# Altium project STM32_LowNoise_Amplifier.PrjPcb
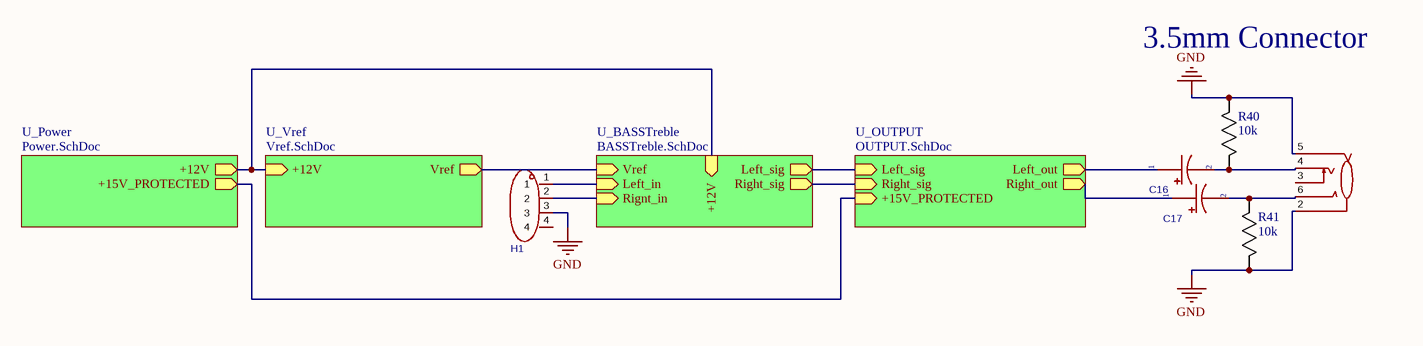
[diagram p0: TOP.SchDoc]
5 sheets, 88 parts. Net scope: hierarchical (ports join the sheet entries above them; power ports are global).
Board file: PCB1.PcbDoc
Sheets:
  TOP.SchDoc
    U_BASSTreble = BASSTreble.SchDoc
    U_Vref = Vref.SchDoc
    U_Power = Power.SchDoc
    U_OUTPUT = OUTPUT.SchDoc

## Sheet TOP.SchDoc
size A4; SheetNumber: 1; SheetTotal: 5

### Parts
C16  2200uF  [ELC CAP D=5]  (value not drawn)
C17  2200uF  [ELC CAP D=5]  (value not drawn)
CN1  pj-327a_c49284723  [3.5mm 5pin SMD]  (value not drawn)
H1  pz254r-11-04p  [4pin connector]  (value not drawn)
R40  10k  [0603 RES]
R41  10k  [0603 RES]

### Sub-sheets
U_BASSTreble = BASSTreble.SchDoc: Vref (in), Left_in (in), Rignt_in (in), Left_sig (out), Right_sig (out), +12V (in)
U_OUTPUT = OUTPUT.SchDoc: Left_sig (in), Right_sig (in), +15V_PROTECTED (in), Left_out (out), Right_out (out)
U_Power = Power.SchDoc: +12V (out), +15V_PROTECTED (out)
U_Vref = Vref.SchDoc: Vref (out), +12V (in)

### Nets
+12V: sheet U_BASSTreble/+12V, sheet U_Vref/+12V, sheet U_Power/+12V
+15V_PROTECTED: sheet U_Power/+15V_PROTECTED, sheet U_OUTPUT/+15V_PROTECTED
GND: CN1.2 CN1.5 H1.3 R40.1 R41.2
Vref: sheet U_BASSTreble/Vref, sheet U_Vref/Vref
NetC12_1: H1.1 ; sheet U_BASSTreble/Left_in
NetC16_1: C16.1 ; sheet U_OUTPUT/Left_out
NetC16_2: C16.2 CN1.4 R40.2
NetC17_1: C17.1 ; sheet U_OUTPUT/Right_out
NetC17_2: C17.2 CN1.6 R41.1
NetC24_1: H1.2 ; sheet U_BASSTreble/Rignt_in
NetR19_1: sheet U_BASSTreble/Left_sig, sheet U_OUTPUT/Left_sig
NetR33_1: sheet U_BASSTreble/Right_sig, sheet U_OUTPUT/Right_sig

Not connected (* = marked no-connect by the designer): CN1 3; H1 4

### Notes on the sheet
- (near R40) 3.5mm Connector

### Library data of the parts
C16 C17 = CAP_ELECTROLYTIC: Tolerance:±20% Voltage Rating:25V Pin Spacing:5mm Diameter:12.5mm Height - Seated (Max):25mm Lifetime:2000hrs@105℃ Operating Temperature:-40℃~+105℃ Operating Temperature:-40℃~+105℃ Polarity type:Polarized; Manufacturer: Jianghai(南通江海); Symbol: ECR1EBK222MLL125025; AddInBom: yes; ModelId: bba5f7414a9d4a73a222d32de1544099; ModelName: CAP-TH_D12.5-H20.0-P5.00; ModelTransform: 492.5187,492.11201,0,0,0,0,0,0,-137.795; Tolerance: ±20%; Voltage Rating: 25V; Pin Spacing: 5mm; LCSC Part Name: 2200uF ±20% 25V; SupplierPart: C233102; ManufacturerPart: ECR1EBK222MLL125025; Supplier Footprint: 插件; JLCPCB Part Class: Extended Part; Datasheet: https://item.szlcsc.com/datasheet/ECR1EBK222MLL125025/232937.html; Supplier: LCSC; ConvertToPcb: yes; FootprintName: CAP-TH_BD12.5-P5.00-D0.6-FD; Value: 2200uF; Diameter: 12.5mm; Height - Seated (Max): 25mm; Lifetime: 2000hrs@105℃; Operating Temperature: -40℃~+105℃; Polarity type: Polarized
CN1 = 3.5mm 5pin SMD: Connector Type:3.5mm Headphone Jack Current Rating:500mA Voltage Rating (Max):30V Contact Material:Copper Contact Plating:Silver Operating Temperature:-25℃~+85℃ Operating Temperature:-25℃~+85℃ Rank Number:TRRS Mounting Style:Surface Mount Color:Black Body; Manufacturer: XUNPU(讯普); AddInBom: yes; ModelId: 28a3bb7a9e024b9f97707116e53a84e6; ModelName: AUDIO-SMD_XUNPU_PJ-327A; ModelTransform: 559.054,338.55094,0,0,0,0,-55.118,0,-25.591; Current Rating: 500mA; Voltage Rating (Max): 30V; Rank Number: TRRS; Body Height: 4.4mm; Symbol: PJ-327A; LCSC Part Name: 3.5mm耳机座; SupplierPart: C49284723; ManufacturerPart: PJ-327A; Supplier Footprint: SMD; JLCPCB Part Class: Extended Part; Datasheet: https://item.szlcsc.com/datasheet/PJ-327A/51736272.html; Supplier: LCSC; ConvertToPcb: yes; FootprintName: AUDIO-SMD_XUNPU_PJ-327A; Connector Type: 3.5mm Headphone Jack; Contact Material: Copper; Contact Plating: Silver; Operating Temperature: -25℃~+85℃; Mounting Style: Surface Mount; Color: Black; Length: 14.2mm; Width: 6mm
H1 = 4pin connector: Pin Structure:1x4P Pitch:2.54mm Row Spacing:- Circluar Pins/Square Pins:Pin Header Mounting Type:Right Angle Number of Rows:1 Number of Pins:4P Current Rating:3A Voltage Rating (Max):250V Length of Mating Pin:6mm Insulation Height:2.5mm Length of End Conn; Manufacturer: XFCN(兴飞); AddInBom: yes; ModelId: 13284729e4054d7b9656609df5ff9409; ModelName: HDR-TH_4P-P2.54-M-WI-1X4P; ModelTransform: 399.999,417.322,0,180,0,0,0,-196.85,-118.11; Pin Structure: 1x4P; Pitch: 2.54mm; Current Rating: 3A; Voltage Rating (Max): 250V; Symbol: PZ254R-11-04P; LCSC Part Name: 1x4P 间距:2.54mm 方针 弯插; SupplierPart: C492412; ManufacturerPart: PZ254R-11-04P; Supplier Footprint: 弯插,P=2.54mm; JLCPCB Part Class: Extended Part; Datasheet: https://item.szlcsc.com/datasheet/PZ254R-11-04P/502968.html; Supplier: LCSC; ConvertToPcb: yes; FootprintName: HDR-TH_4P-P2.54-H-M-W10.4; Row Spacing: -; Circluar Pins/Square Pins: Pin Header; Mounting Type: Right Angle; Number of Rows: 1; Number of Pins: 4P; Length of Mating Pin: 6mm; Insulation Height: 2.5mm; Length of End Connection Pin: -; Contact Material: Brass; Contact Plating: -; Operating Temperature: -40℃~+105℃; Color: Black
R40 R41 = Resistor: Manufacturer_Name: Vishay; Manufacturer_Part_Number: CRCW060310K0FKEA; Copyright: Copyright (C) 2025 Ultra Librarian. All rights reserved.

## Sheet BASSTreble.SchDoc
size A4; SheetNumber: 3; SheetTotal: 5
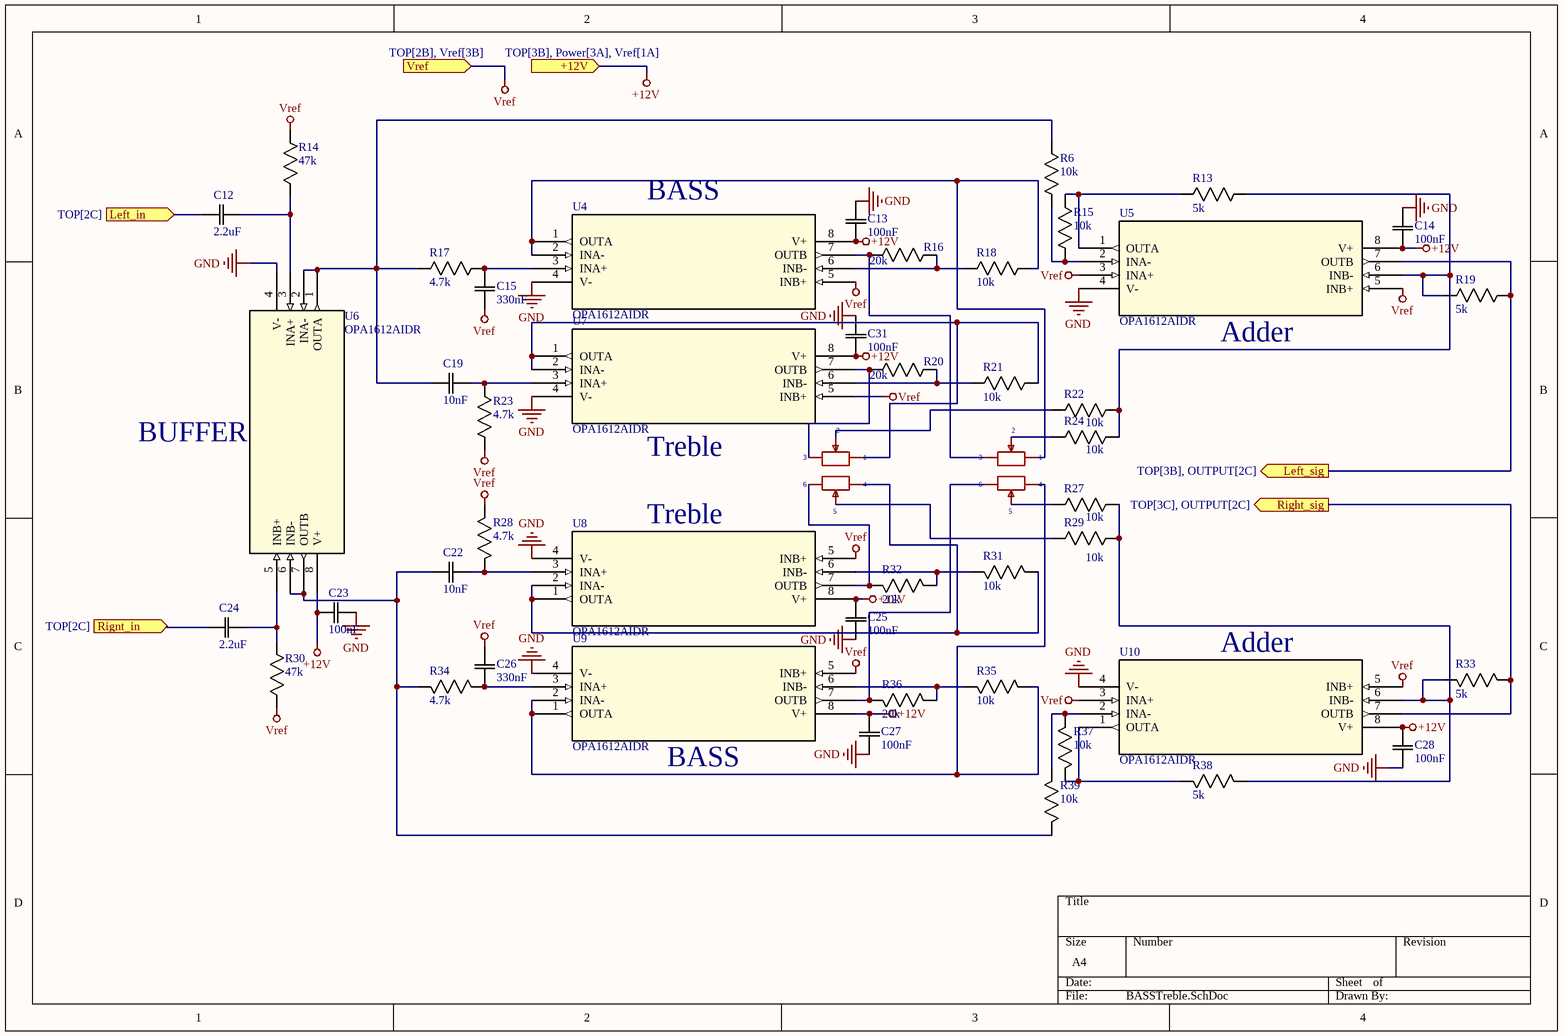
[diagram p1: BASSTreble.SchDoc]

### Parts
C12  2.2uF  [0603 Cap - C0G]
C13  100nF  [0603 Cap - C0G]
C14  100nF  [0603 Cap - C0G]
C15  330nF  [1206 CAP C0G]
C19  10nF  [0805 CAP - C0G]
C22  10nF  [0805 CAP - C0G]
C23  100nF  [0603 Cap - C0G]
C24  2.2uF  [0603 Cap - C0G]
C25  100nF  [0603 Cap - C0G]
C26  330nF  [1206 CAP C0G]
C27  100nF  [0603 Cap - C0G]
C28  100nF  [0603 Cap - C0G]
C31  100nF  [0603 Cap - C0G]
R6  10k  [0603 RES]
R13  5k  [0603 RES]
R14  47k  [0603 RES]
R15  10k  [0603 RES]
R16  20k  [0603 RES]
R17  4.7k  [0603 RES]
R18  10k  [0603 RES]
R19  5k  [0603 RES]
R20  20k  [0603 RES]
R21  10k  [0603 RES]
R22  10k  [0603 RES]
R23  4.7k  [0603 RES]
R24  10k  [0603 RES]
R25  10K  [Potentiometers 10K RK16312101A2]  (value not drawn)
R26  10K  [Potentiometers 10K RK16312101A2]  (value not drawn)
R27  10k  [0603 RES]
R28  4.7k  [0603 RES]
R29  10k  [0603 RES]
R30  47k  [0603 RES]
R31  10k  [0603 RES]
R32  20k  [0603 RES]
R33  5k  [0603 RES]
R34  4.7k  [0603 RES]
R35  10k  [0603 RES]
R36  20k  [0603 RES]
R37  10k  [0603 RES]
R38  5k  [0603 RES]
R39  10k  [0603 RES]
U4  OPA1612AIDR  [OPA1612AIDR]
U5  OPA1612AIDR  [OPA1612AIDR]
U6  OPA1612AIDR  [OPA1612AIDR]
U7  OPA1612AIDR  [OPA1612AIDR]
U8  OPA1612AIDR  [OPA1612AIDR]
U9  OPA1612AIDR  [OPA1612AIDR]
U10  OPA1612AIDR  [OPA1612AIDR]

### Ports
+12V (in, see TOP[3B], Power[3A], Vref[1A]), Left_in (in, see TOP[2C]), Left_sig (out, see TOP[3B], OUTPUT[2C]), Right_sig (out, see TOP[3C], OUTPUT[2C]), Rignt_in (in, see TOP[2C]), Vref (in, see TOP[2B], Vref[3B])

### Nets
+12V: C13.1 C14.1 C23.1 C25.2 C27.2 C28.2 C31.1 U4.8(V+) U5.8(V+) U6.8(V+) U7.8(V+) U8.8(V+) U9.8(V+) U10.8(V+) ; port +12V
GND: C13.2 C14.2 C23.2 C25.1 C27.1 C28.1 C31.2 U4.4(V-) U5.4(V-) U6.4(V-) U7.4(V-) U8.4(V-) U9.4(V-) U10.4(V-)
Vref: C15.1 C26.2 R14.1 R23.1 R28.1 R30.1 U4.5(INB+) U5.3(INA+) U5.5(INB+) U7.5(INB+) U8.5(INB+) U9.5(INB+) U10.3(INA+) U10.5(INB+) ; port Vref
NetC12_1: C12.1 ; port Left_in
NetC12_2: C12.2 R14.2 U6.3(INA+)
NetC15_2: C15.2 R17.2 U4.3(INA+)
NetC19_1: C19.1 R6.2 R17.1 U6.1(OUTA) U6.2(INA-)
NetC19_2: C19.2 R23.2 U7.3(INA+)
NetC22_1: C22.1 R34.1 R39.2 U6.6(INB-) U6.7(OUTB)
NetC22_2: C22.2 R28.2 U8.3(INA+)
NetC24_1: C24.1 ; port Rignt_in
NetC24_2: C24.2 R30.2 U6.5(INB+)
NetC26_1: C26.1 R34.2 U9.3(INA+)
NetR6_1: R6.1 R15.1 U5.2(INA-)
NetR13_1: R13.1 R19.2 R22.2 R24.2 U5.6(INB-)
NetR13_2: R13.2 R15.2 U5.1(OUTA)
NetR16_1: R16.1 R25.3 U4.7(OUTB)
NetR16_2: R16.2 R18.1 U4.6(INB-)
NetR18_2: R18.2 R25.1 U4.1(OUTA) U4.2(INA-)
NetR19_1: R19.1 U5.7(OUTB) ; port Left_sig
NetR20_1: R20.1 R26.3 U7.7(OUTB)
NetR20_2: R20.2 R21.1 U7.6(INB-)
NetR21_2: R21.2 R26.1 U7.1(OUTA) U7.2(INA-)
NetR22_1: R22.1 R26.2
NetR24_1: R24.1 R25.2
NetR25_4: R25.4 R35.2 U9.1(OUTA) U9.2(INA-)
NetR25_5: R25.5 R27.1
NetR25_6: R25.6 R36.1 U9.7(OUTB)
NetR26_4: R26.4 R31.2 U8.1(OUTA) U8.2(INA-)
NetR26_5: R26.5 R29.1
NetR26_6: R26.6 R32.1 U8.7(OUTB)
NetR27_2: R27.2 R29.2 R33.2 R38.1 U10.6(INB-)
NetR31_1: R31.1 R32.2 U8.6(INB-)
NetR33_1: R33.1 U10.7(OUTB) ; port Right_sig
NetR35_1: R35.1 R36.2 U9.6(INB-)
NetR37_1: R37.1 R39.1 U10.2(INA-)
NetR37_2: R37.2 R38.2 U10.1(OUTA)

### Notes on the sheet
- (near U4) BASS
- (near U5) Adder
- (near U6) BUFFER
- (near U7) Treble
- (near U8) Treble
- (near U10) Adder
- (near U9) BASS

### Library data of the parts
C12-C15 C19 C22-C28 C31 = CAP_CERAMIC: Manufacturer_Name: Kemet; Manufacturer_Part_Number: C0603C104K5RACTU; Copyright: Copyright (C) 2026 Ultra Librarian. All rights reserved.
R6 R13-R24 R27-R39 = Resistor: as R40 on sheet TOP; Copyright: Copyright (C) 2025 Ultra Librarian. All rights reserved.
R25 R26 = Potentiometers 10K RK16312101A2: Resistance: 10K Tolerance:±20% Tolerance:±20% Rated Voltage:- Power(Watts):- Turns:; Manufacturer: ALPSALPINE(阿尔卑斯阿尔派); AddInBom: yes; ModelId: 92b7132f4c3c4015aff86e677bf882d2; ModelName: RES-ADJ-TH_RK16312A0BKR; ModelTransform: 1066.927,708.66,0,0,0,0,326.772,0,-137.795; Value: 10kΩ; Tolerance: ±20%; Symbol: RK16312101A2; LCSC Part Name: 10kΩ ±20% 三件套; SupplierPart: C470593; ManufacturerPart: RK16312101A2; Supplier Footprint: 插件-6P; JLCPCB Part Class: Extended Part; Datasheet: https://atta.szlcsc.com/upload/public/pdf/source/20191216/C470593_7E935C2EB9A734DEAF0A292D32EDD773.pdf; Supplier: LCSC; ConvertToPcb: yes; FootprintName: RES-ADJ-TH_RK16312A0BKR; Rated Voltage: -; Power(Watts): -
U4-U10 = OPA1612AIDR: SoundPlusâ„¢ Audio Operational Amplifier with 1.1nV/âˆšHz Noise, Low THD and Precision 8-SOIC -40 to 85; Manufacturer_Name: Texas Instruments; Copyright: Copyright (C) 2025 Ultra Librarian. All rights reserved.; Manufacturer_Part_Number: OPA1612AIDR; RefDes: RefDes; Type: Type

## Sheet Vref.SchDoc
size A4; SheetNumber: 2; SheetTotal: 5
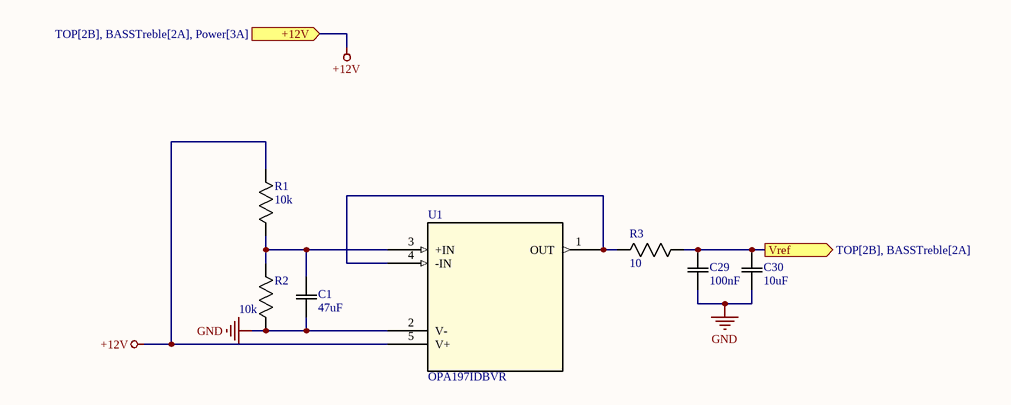
[diagram p2: Vref.SchDoc]

### Parts
C1  47uF  [1210 CAP]
C29  100nF  [0603 Cap - C0G]
C30  10uF  [0805 CAP - C0G]
R1  10k  [0603 RES]
R2  10k  [0603 RES]
R3  10  [0805 RES]
U1  OPA197IDBVR  [OPA197IDBVR]

### Ports
+12V (in, see TOP[2B], BASSTreble[2A], Power[3A]), Vref (out, see TOP[2B], BASSTreble[2A])

### Nets
+12V: R1.1 U1.5(V+) ; port +12V
GND: C1.1 C29.2 C30.1 R2.2 U1.2(V-)
Vref: C29.1 C30.2 R3.1 ; port Vref
NetC1_2: C1.2 R1.2 R2.1 U1.3(+IN)
NetR3_2: R3.2 U1.1(OUT) U1.4(-IN)

### Library data of the parts
C1 C29 C30 = CAP_CERAMIC: as C12 on sheet BASSTreble; Copyright: Copyright (C) 2026 Ultra Librarian. All rights reserved.
R1-R3 = Resistor: as R40 on sheet TOP; Copyright: Copyright (C) 2025 Ultra Librarian. All rights reserved.
U1 = OPA197IDBVR: Single, 36-V, precision, rail-to-rail input output, low offset voltage op amp 5-SOT-23 -40 to 125; Manufacturer_Name: Texas Instruments; Copyright: Copyright (C) 2026 Ultra Librarian. All rights reserved.; Manufacturer_Part_Number: OPA197IDBVR; RefDes: RefDes; Type: Type

## Sheet Power.SchDoc
size A4; SheetNumber: 4; SheetTotal: 5
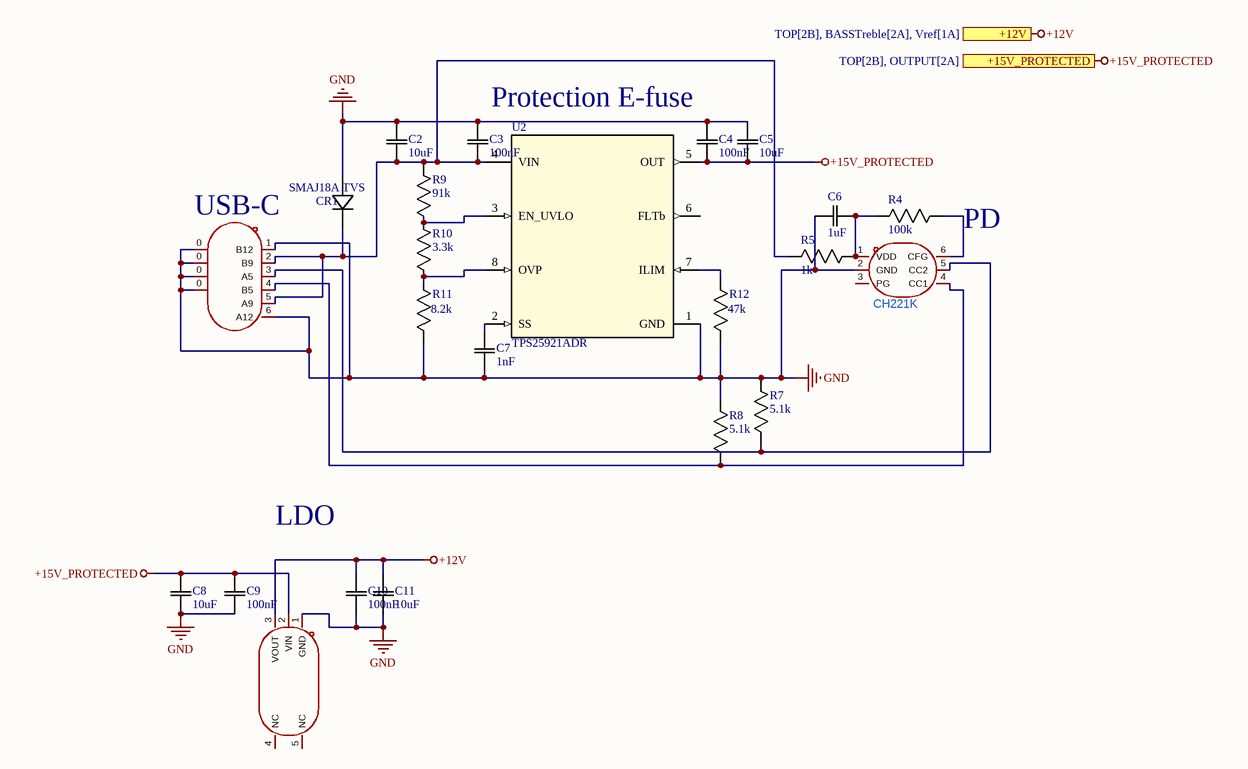
[diagram p3: Power.SchDoc]

### Parts
C2  10uF  [0805 CAP - C0G]
C3  100nF  [0603 Cap - C0G]
C4  100nF  [0603 Cap - C0G]
C5  10uF  [0805 CAP - C0G]
C6  1uF  [0603 Cap - C0G]
C7  1nF  [0603 Cap - C0G]
C8  10uF  [0805 CAP - C0G]
C9  100nF  [0603 Cap - C0G]
C10  100nF  [0603 Cap - C0G]
C11  10uF  [0805 CAP - C0G]
CR1  SMAJ18A TVS  [TVS diode]
Q1  CH221K  [CH221K]
R4  100k  [0603 RES]
R5  1k  [0603 RES]
R7  5.1k  [0603 RES]
R8  5.1k  [0603 RES]
R9  91k  [0603 RES]
R10  3.3k  [0603 RES]
R11  8.2k  [0603 RES]
R12  47k  [0603 RES]
U2  TPS25921ADR  [TPS25921ADR e-fuse]
U3  ht75c0-2  [LDO]  (value not drawn)
USB2  type-c-31-m-17  [USB-C-SMD_10P-P1.00-L6.8-W8.9]  (value not drawn)

### Ports
+12V (out, see TOP[2B], BASSTreble[2A], Vref[1A]), +15V_PROTECTED (out, see TOP[2B], OUTPUT[2A])

### Nets
+12V: C10.2 C11.2 U3.3(VOUT) ; port +12V
+15V_PROTECTED: C4.1 C5.1 C8.2 C9.2 U2.5(OUT) U3.2(VIN) ; port +15V_PROTECTED
GND: C2.2 C3.2 C4.2 C5.2 C6.1 C7.1 C8.1 C9.1 C10.1 C11.1 CR1.2 Q1.2(GND) R7.1 R8.1 R11.2 R12.2 U2.1(GND) U3.1(GND) USB2.0 USB2.1(B12) USB2.6(A12)
NetC2_1: C2.1 C3.1 CR1.1 R5.1 R9.1 U2.4(VIN) USB2.2(B9) USB2.5(A9)
NetC6_2: C6.2 Q1.1(VDD) R4.2 R5.2
NetC7_2: C7.2 U2.2(SS)
NetQ1_4: Q1.4(CC1) R8.2 USB2.4(B5)
NetQ1_5: Q1.5(CC2) R7.2 USB2.3(A5)
NetQ1_6: Q1.6(CFG) R4.1
NetR9_2: R9.2 R10.1 U2.3(EN_UVLO)
NetR10_2: R10.2 R11.1 U2.8(OVP)
NetR12_1: R12.1 U2.7(ILIM)

Not connected (* = marked no-connect by the designer): Q1 3(PG); U2 6(FLTb); U3 4(NC) 5(NC)

### Notes on the sheet
- Protection E-fuse
- (near USB2) USB-C
- PD
- LDO

### Library data of the parts
C2-C11 = CAP_CERAMIC: as C12 on sheet BASSTreble; Copyright: Copyright (C) 2026 Ultra Librarian. All rights reserved.
CR1 = SMAJ18A TVS: Description; Manufacturer_Name: Bourns Electronics; Copyright: Copyright (C) 2026 Ultra Librarian. All rights reserved.; Manufacturer_Part_Number: SMAJ18A
Q1 = CH221K: 100W PD3.2 / 100K请求15V; Manufacturer: WCH(南京沁恒); AddInBom: yes; ModelId: 838e09e61e8e47a1ac5306b7bfd21d61; ModelName: SOT-23-6_L2.9-W1.6-P0.95-LS2.8-BL-2; ModelTransform: 114.173,110.236,0,0,0,0,0,0,0; Type: Power Receiver Controller; Protocol: PD 3.0; Output Voltage: 5V；20V；15V；12V；9V; Symbol: CH221K; LCSC Part Name: USBPD多快充协议受电芯片; SupplierPart: C5125736; ManufacturerPart: CH221K; Supplier Footprint: SOT-23-6; JLCPCB Part Class: Extended Part; Datasheet: https://item.szlcsc.com/datasheet/CH221K/5724821.html; Supplier: LCSC; ConvertToPcb: yes; FootprintName: SOT-23-6_L2.9-W1.6-P0.95-LS2.8-BL-2; Number of Channels: -; Output Power: 100W; Voltage - Supply: -; Operating Temperature: -40℃~+105℃
R4 R5 R7-R12 = Resistor: as R40 on sheet TOP; Copyright: Copyright (C) 2025 Ultra Librarian. All rights reserved.
U2 = TPS25921ADR e-fuse: 4.5-V to 18-V, 90mÎ©, 0.4-1.6A eFuse with auto retry fault response 8-SOIC -40 to 85; Manufacturer_Name: Texas Instruments; CompType: IC; TYPE: TYPE; RefDes: RefDes; Copyright: Copyright (C) 2026 Ultra Librarian. All rights reserved.; Manufacturer_Part_Number: TPS25921ADR; PartNumber: TPS25921AD; PackageReference: D0008A; MountType: SMT; RoHS: Y; Manufacturer: Texas Instruments
U3 = ht75c0-2 LDO: Output Configuration:Positive Voltage - Supply:30V Output Voltage:12V Output Voltage:12V Output Current:150mA Power Supply Rejection Ratio (PSRR):- Voltage Dropout:25mV@(1mA) standby current:2.5uA Operating Temperature:-40℃~+85℃ Operating Temperature:-40℃; Manufacturer: HOLTEK(合泰/盛群); AddInBom: yes; ModelId: 3168b22659ce4998ae232d44bb704e0a; ModelName: SOT-23-5_L2.9-W1.6-H1.1-LS2.8-P0.95; ModelTransform: 114.173,109.636,0,180,0,0,0,0,0; Voltage - Supply: 30V; Output Voltage: 12V; Output Current: 150mA; standby current: 2.5uA; Output Type: Fixed; Number of Outputs: 1; Symbol: HT75C0-2; LCSC Part Name: 12V 150mA 30V; SupplierPart: C95005; ManufacturerPart: HT75C0-2; Supplier Footprint: SOT-23-5; JLCPCB Part Class: Extended Part; Supplier: LCSC; ConvertToPcb: yes; FootprintName: SOT-23-5_L3.0-W1.7-P0.95-LS2.8-BR; Output Configuration: Positive; Power Supply Rejection Ratio (PSRR): -; Voltage Dropout: 25mV@(1mA); Operating Temperature: -40℃~+85℃
USB2 = type-c-31-m-17: Connector Type:Type-C Protocol Standard:- Gender:Female Mounting Type:Surface Mount, Right Angle Number of Contacts:6P Number of Ports:1 Current Rating-Power:5A Voltage Rating:20V Connect-Disconnect Life:3,000 Cycles Length:6.8mm Operating Temperature:-30; Manufacturer: 韩国韩荣; AddInBom: yes; ModelId: ab6076bf4dcb42b58b12fcacb7ccdaa0; ModelName: TYPE-C-SMD_6P-L8.9-W6.8-H3.2-P1.00; ModelTransform: 351.9678,267.716,0,180,0,0,-0.001,-47.957,-39.37; Connector Type: Type-C; Gender: Female; Number of Contacts: 6P; Number of Ports: 1; Current Rating-Power: 5A; Voltage Rating: 20V; Symbol: TYPE-C-31-M-17; Supplier: LCSC; Supplier Part: C283540; Manufacturer Part: TYPE-C-31-M-17; JLCPCB Part Class: Extended Part; LCSC Part Name: Type-C 母 卧贴; Supplier Footprint: SMD; Datasheet: https://item.szlcsc.com/datasheet/TYPE-C-31-M-17/269351.html; ConvertToPcb: yes; FootprintName: USB-C-SMD_10P-P1.00-L6.8-W8.9; Protocol Standard: -; Mounting Type: Surface Mount, Right Angle; Connect-Disconnect Life: 3,000 Cycles; Length: 6.8mm; Operating Temperature: -30℃~+80℃

## Sheet OUTPUT.SchDoc
size A4; SheetNumber: 5; SheetTotal: 5
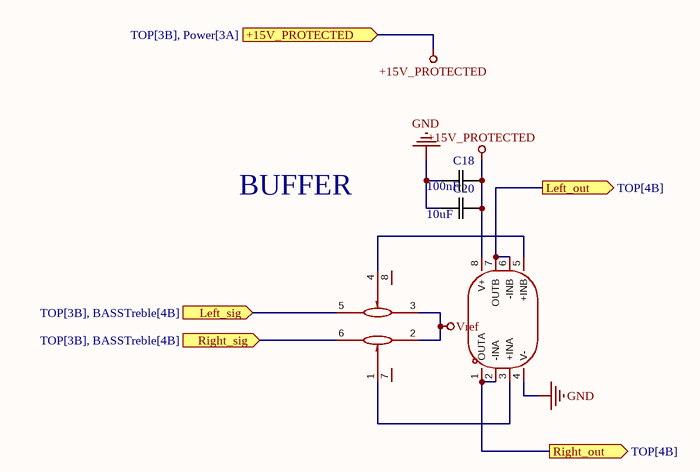
[diagram p4: OUTPUT.SchDoc]

### Parts
C18  100nF  [0603 Cap - C0G]
C20  10uF  [0805 CAP - C0G]
U11  rk12l12c0a0e  [LOG Potentiometer]  (value not drawn)
U12  opa1656idr  [OPA1656IDR]  (value not drawn)

### Ports
+15V_PROTECTED (in, see TOP[3B], Power[3A]), Left_out (out, see TOP[4B]), Left_sig (in, see TOP[3B], BASSTreble[4B]), Right_out (out, see TOP[4B]), Right_sig (in, see TOP[3B], BASSTreble[4B])

### Nets
+15V_PROTECTED: C18.2 C20.2 U12.8(V+) ; port +15V_PROTECTED
GND: C18.1 C20.1 U12.4(V-)
Vref: U11.2 U11.3
NetC16_1: U12.6(-INB) U12.7(OUTB) ; port Left_out
NetC17_1: U12.1(OUTA) U12.2(-INA) ; port Right_out
NetR19_1: U11.5 ; port Left_sig
NetR33_1: U11.6 ; port Right_sig
NetU11_1: U11.1 U12.3(+INA)
NetU11_4: U11.4 U12.5(+INB)

Not connected (* = marked no-connect by the designer): U11 7(EH) 8(EH)

### Notes on the sheet
- BUFFER

### Library data of the parts
C18 C20 = CAP_CERAMIC: as C12 on sheet BASSTreble; Copyright: Copyright (C) 2026 Ultra Librarian. All rights reserved.
U11 = LOG Potentiometer: Resistance: Tolerance:±20% Tolerance:±20% Rated Voltage: Power(Watts):50mW Turns:-; Manufacturer: ALPSALPINE(阿尔卑斯阿尔派); AddInBom: yes; ModelId: 34e0376d5eee43e6a3b83596b84c8b47; ModelName: RES-ADJ-TH_RK12L1230C1M; ModelTransform: 535.43082,681.101,0,0,0,0,-0.004,112.202,-145.669; Value: 10kΩ; Tolerance: ±20%; Power(Watts): 50mW; Symbol: RK12L12C0A0E; LCSC Part Name: 10kΩ ±20%; SupplierPart: C470285; ManufacturerPart: RK12L12C0A0E; Supplier Footprint: 插件-6P,15.5x12mm; JLCPCB Part Class: Extended Part; Datasheet: https://atta.szlcsc.com/upload/public/pdf/source/20191216/C470380_93C0132B2AE7BA8B014CE4021E4797E4.pdf; Supplier: LCSC; ConvertToPcb: yes; FootprintName: RES-ADJ-TH_RK12L1230C1M; Turns: -
U12 = opa1656idr: Number of Channels:2 Gain Bandwidth Product:53MHz Ib - Input Bias Current:20pA Vos - Input Offset Voltage:1mV Common Mode Rejection Ratio(CMRR):120dB Slew Rate:24V/us Quiescent Current(Iq):3.9mA Rail To Rail:Rail-to-rail output Input Offset Voltage Drift(; Manufacturer: TI(德州仪器); AddInBom: yes; ModelId: 2ec1ac1bf9bf4d09a988fcee15e6a02d; ModelName: SOIC-8_L4.9-W3.9-H1.7-LS6.0-P1.27; ModelTransform: 192.913,236.22,0,0,0,0,0,0,0; Number of Channels: 2; Gain Bandwidth Product: 53MHz; Ib - Input Bias Current: 20pA; Vos - Input Offset Voltage: 1mV; Common Mode Rejection Ratio(CMRR): 120dB; Slew Rate: 24V/us; Quiescent Current(Iq): 3.9mA; Input Offset Voltage Drift(Vos TC): 2uV/℃; Output Current: 100mA; Single Supply: 4.5V~36V; Dual Supply: -18V~-2.25V；2.25V~18V; Noise density(eN): 4.3nV/√Hz@1kHz; Symbol: OPA1656IDR; LCSC Part Name: 超低噪声、低失真、FET输入音频运算放大器; SupplierPart: C1849431; ManufacturerPart: OPA1656IDR; Supplier Footprint: SOIC-8; JLCPCB Part Class: Extended Part; Datasheet: https://www.ti.com/cn/lit/ds/symlink/opa1656.pdf; Supplier: LCSC; ConvertToPcb: yes; FootprintName: SOIC-8_L4.9-W3.9-P1.27-LS6.0-BL; Rail To Rail: Rail-to-rail output; Operating Temperature: -40℃~+125℃; Input Offset Current(Ios): 20pA

## Nets that join several sheets
+12V: BASSTreble (14 pins), Vref (R1.1 U1.5), Power (C10.2 C11.2 U3.3)
+15V_PROTECTED: Power (6 pins), OUTPUT (C18.2 C20.2 U12.8)
GND: TOP (5 pins), BASSTreble (14 pins), Vref (5 pins), Power (21 pins), OUTPUT (C18.1 C20.1 U12.4)
Vref: BASSTreble (14 pins), Vref (C29.1 C30.2 R3.1), OUTPUT (U11.2 U11.3)
NetC12_1: TOP (H1.1), BASSTreble (C12.1)
NetC16_1: TOP (C16.1), OUTPUT (U12.6 U12.7)
NetC17_1: TOP (C17.1), OUTPUT (U12.1 U12.2)
NetC24_1: TOP (H1.2), BASSTreble (C24.1)
NetR19_1: BASSTreble (R19.1 U5.7), OUTPUT (U11.5)
NetR33_1: BASSTreble (R33.1 U10.7), OUTPUT (U11.6)